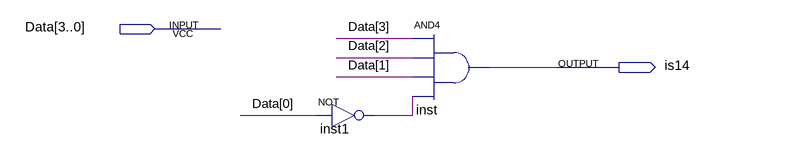
[diagram p0: schematic sheet]
// Quartus schematic check14.bdf as structural Verilog: 2 symbols, 2 pins
module check14 (
  input  [3:0] Data,
  output is14
);

  wire inst1_out;

  not inst1 (inst1_out, Data[0]);
  and inst (is14, Data[3], Data[2], Data[1], inst1_out);
endmodule
